# Altium schematic sheet Power_Sheet.SchDoc
size A4; SheetNumber: 1; SheetTotal: 1
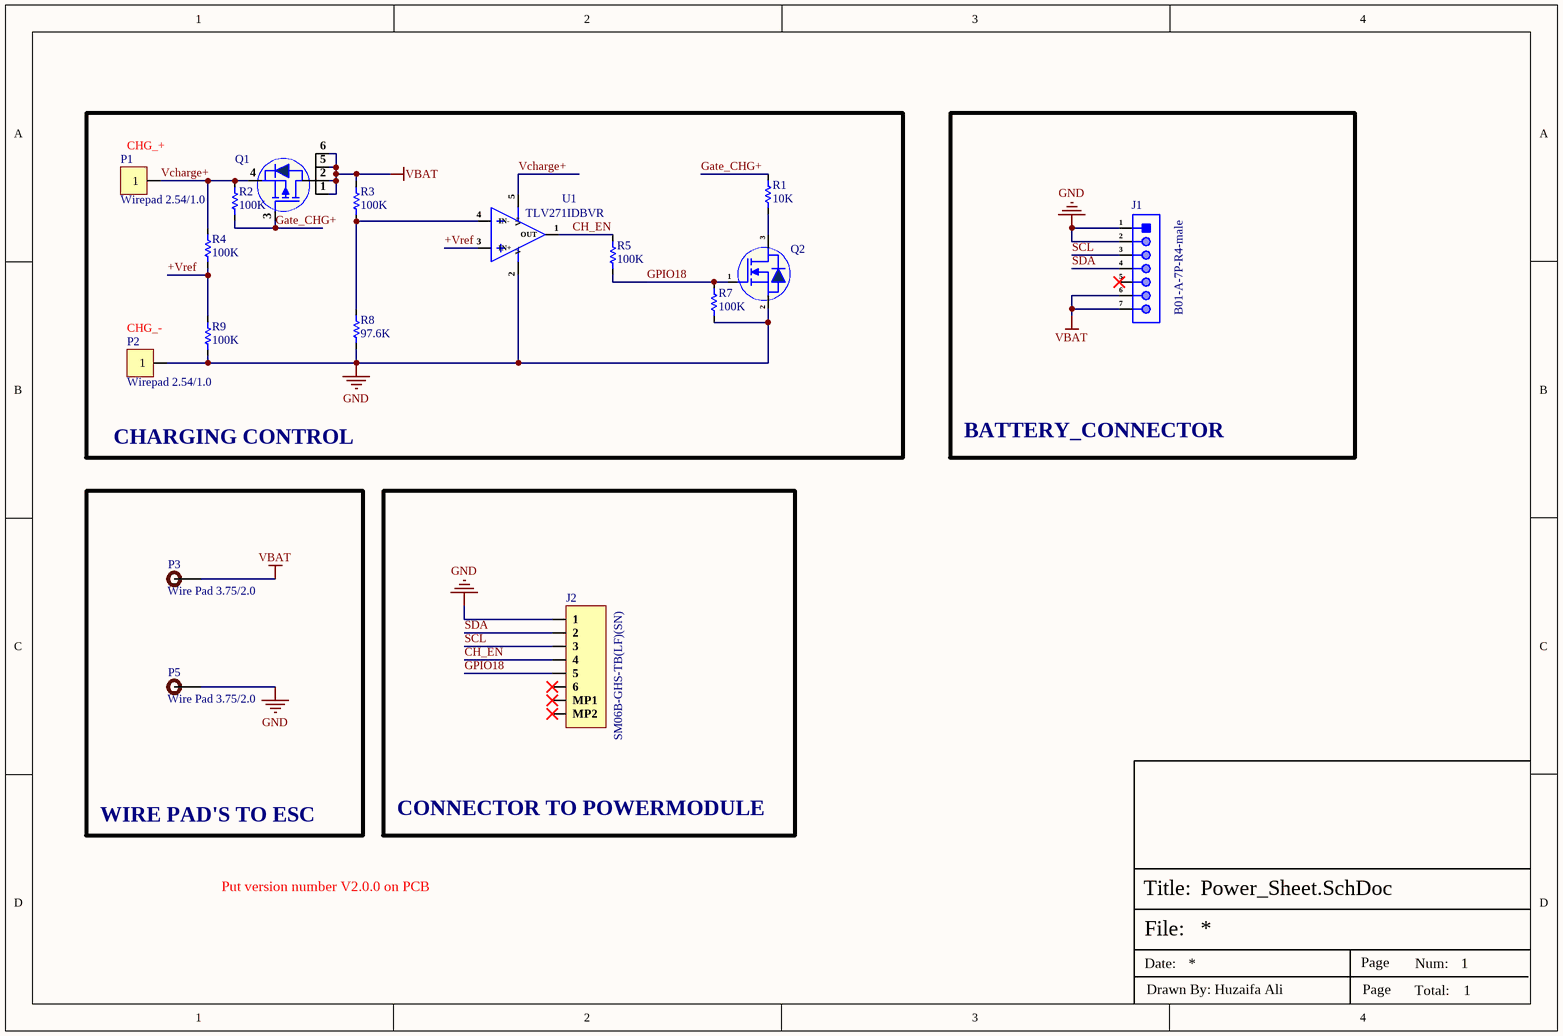
[diagram p0: Power_Sheet.SchDoc]

## Parts
J1  B01-A-7P-R4-male  [B01-A-7P-R4-male]
J2  SM06B-GHS-TB(LF)(SN)  [SM06B-GHS-TB(LF)(SN)]
P1  Wirepad 2.54/1.0  [Wirepad 2.54/1.0]  (no BOM)
P2  Wirepad 2.54/1.0  [Wirepad 2.54/1.0]  (no BOM)
P3  Wire Pad 3.75/2.0  [Wire Pad 3.75/2.0]  (no BOM)
P5  Wire Pad 3.75/2.0  [Wire Pad 3.75/2.0]  (no BOM)
Q1  IRLTS2242TRPBF  [6-TSOP_]  (value not drawn)
Q2  2N7002KT1G  [SOT-23]  (value not drawn)
R1  10K  [Res-0402]
R2  100K  [Res-0402]
R3  100K  [Res-0402]
R4  100K  [Res-0402]
R5  100K  [Res-0402]
R7  100K  [Res-0402]
R8  97.6K  [Res-0402]
R9  100K  [Res-0402]
U1  TLV271IDBVR  [SOT-23-5]

## Blocks framed on the sheet
CHARGING CONTROL: P1 P2 Q1 Q2 R1-R5 R7-R9 U1
BATTERY_CONNECTOR: J1
WIRE PAD'S TO ESC: P3 P5
CONNECTOR TO POWERMODULE: J2

## Nets
GND: J1.1 J1.2 J2.1 P2.1 P5.1 Q2.2(S) R7.2 R8.1 R9.2 U1.2(V-)
VBAT: J1.6 J1.7 P3.1 Q1.1(D) Q1.2(D) Q1.5(D) Q1.6(D) R3.1
+Vref: R4.2 R9.1 U1.3(IN+)
CH_EN: J2.4 R5.1 U1.1(OUT)
Gate_CHG+: Q1.3(G) R1.2 R2.2
GPIO18: J2.5 Q2.1(G) R5.2 R7.1
SCL: J1.3 J2.3
SDA: J1.4 J2.2
Vcharge+: P1.1 Q1.4(S) R2.1 R4.1 U1.5(V+)
NetQ2_3: Q2.3(D) R1.1
NetR3_2: R3.2 R8.2 U1.4(IN-)

Not connected (* = marked no-connect by the designer): J1 5*; J2 6* MP1* MP2*

## Notes on the sheet
- (near P1) CHG_+
- (near P2) CHG_-
- Put version number V2.0.0 on PCB
- File:
- Title:
- Date:
- Page
- Num:
- Total:
- Drawn By: Huzaifa Ali

## Library data of the parts
J1 = B01-A-7P-R4-male: 7 Pin Blade RA Male Connector; Manufacturer: RTLECS; Item Type: Blade Connector; Manufacturer Part Number: B01-A-7P-R4-male; Package: Custom; LCSC Part Number: -; ComponentLink1Description: LCSC; ComponentLink1URL: *
J2 = SM06B-GHS-TB(LF)(SN): CONN HEADER SMD R/A 6POS 1.25MM; Manufacturer: JST; Number of Positions: 6; Current Rating: 1A; Voltage Rating: 50V; Supplier: Future Electronics; LCSC Part Number: C133065; Manufacturer Part Number: SM06B-GHS-TB(LF)(SN); RoHS: Yes; Item Type: Headers; Pricing: 2500=0.25, 5000=0.245, 7500=0.24, 10000=0.235 (USD); Mounting Technology: Surface Mount; Contact Material: Bronze; Contact Shape: Rectangular; Contact Finish - Mating: TIN; Insulation Material: Nylon; Insulation Color: Natural; Min Operating Temperature: -25°C; Max Operating Temperature: 85°C; Number of Rows: 1; Packaging: Cut Tape; Termination: Solder; Fastening Type: Ramp; Connector Type: Header; Number of Contacts: 6; Orientation: Right Angle; Series: GH; Contact Type: Outer Shroud Contact; Pitch: 1.25mm; Lead Free: Lead Free; Flammability Rating: UL94 V-0; ComponentLink1URL: https://datasheet.ciiva.com/25617/0900766b810cef18-25617251.pdf?src-supplier=Rs; ComponentLink1Description: https://datasheet.ciiva.com/25617/0900766b810cef18-25617251.pdf?src-supplier=Rs; ComponentLink2URL: https://datasheet.ciiva.com/16487/jstsm06b-ghs-tb-lf-sn-16487196.pdf?src-supplier=Future+Electronics; ComponentLink2Description: https://datasheet.ciiva.com/16487/jstsm06b-ghs-tb-lf-sn-16487196.pdf?src-supplier=Future+Electronics
P3 P5 = Wire Pad 3.75/2.0: Wire Connecting Pad 3.75/2.0
Q1 = IRLTS2242TRPBF: MOSFET P-CH 20V 6.9A 6TSOP; Manufacturer: Infineon; Item Type: MOSFETs; Turn-Off Delay Time: 18ns; Turn-On Delay Time: 5.8ns; Drain to Source Breakdown Voltage: -20V; Drain to Source Resistance: 26mR; Element Configuration: 5460ElementConfiguration; Fall Time: 68ns; Number of Channels: 1NUMBER; On-State Resistance: -32mR; Power Dissipation: 2W; Value: 55MR; Supplier: Mouser; LCSC Part Number: C538190; Manufacturer Part Number: IRLTS2242TRPBF; RoHS: Yes; Stock: 67736; Pricing: 1=0.44, 10=0.372, 50=0.372, 100=0.259, 1000=0.164, 10000=0.129 (USD); Number of Elements: 1NUMBER; Package Quantity: 3000NUMBER; Length: 3mm; Width: 1.75mm; Height: 1.3mm; Radiation Hardening: 5898YesNo; ComponentLink1URL: http://www.farnell.com/datasheets/1911990.pdf?src-supplier=Farnell; ComponentLink1Description: http://www.farnell.com/datasheets/1911990.pdf?src-supplier=Farnell; ComponentLink2URL: http://www.farnell.com/datasheets/1911990.pdf?src-supplier=Element14; ComponentLink2Description: http://www.farnell.com/datasheets/1911990.pdf?src-supplier=Element14; ComponentLink3URL: https://datasheet.octopart.com/IRLTS2242TRPBF-Infineon-datasheet-41193307.pdf?src-supplier=Newark; ComponentLink3Description: https://datasheet.octopart.com/IRLTS2242TRPBF-Infineon-datasheet-41193307.pdf?src-supplier=Newark; ComponentLink4URL: https://www.infineon.com/dgdl/irlts2242pbf.pdf?fileId=5546d462533600a401535671e9a12718&src-supplier=Digikey; ComponentLink4Description: https://www.infineon.com/dgdl/irlts2242pbf.pdf?fileId=5546d462533600a401535671e9a12718&src-supplier=Digikey; ComponentLink5URL: https://datasheet.octopart.com/IRLTS2242TRPBF-Infineon-datasheet-11534477.pdf?src-supplier=Farnell; ComponentLink5Description: https://datasheet.octopart.com/IRLTS2242TRPBF-Infineon-datasheet-11534477.pdf?src-supplier=Farnell
Q2 = 2N7002KT1G: MOSFET N-CH 60V 320MA SOT23-3; Manufacturer: ON Semiconductor; Input Capacitance: 24.5pF; Max Power Dissipation: 420mW; Rds On Max: 1.6R; Rise Time: 9ns; Nominal Vgs: 2.3V; Number of Elements: 1; Power Dissipation: 300mW; Turn-Off Delay Time: 55.8ns; Turn-On Delay Time: 12.2ns; Element Configuration: Single; Gate to Source Voltage (Vgs): 20V; Polarity: N-CHANNEL; Number of Channels: 1NUMBER; Supplier: Future Electronics; Supplier Part Number: 3445699; Manufacturer Part Number: 2N7002KT1G; RoHS: Yes; Category: MOSFETs; Stock: 51000; Pricing: 3000=0.0238, 12000=0.0228, 45000=0.0218, 75000=0.0215, 150000=0.0204 (USD); Case/Package: SOT-23-3; Pins: 3; Contact Plating: Tin,Matte; Min Operating Temperature: -55°C; Max Operating Temperature: 150°C; Packaging: Tape and Reel; Continuous Drain Current (ID): 320mA; Package Quantity: 1; Drain to Source Breakdown Voltage: 60V; Fall Time: 9ns; Drain to Source Resistance: 1.6R; Threshold Voltage: 2.3V; Series: -; Drain-source On Resistance-Max: 1.6R; Length: 3.04mm; Width: 1.4mm; Height: 1.01mm; Radiation Hardening: No; Reach SVHC Compliant: No; Lead Free: Lead Free; Halogen Free: Halogen Free; RoHS Compliant: Yes; ComponentLink1URL: https://datasheet.ciiva.com/1254/2n7002k-d-1254499.pdf?src-supplier=Newark; ComponentLink1Description: https://datasheet.ciiva.com/1254/2n7002k-d-1254499.pdf?src-supplier=Newark; ComponentLink2URL: https://datasheet.ciiva.com/16220/2n7002k-d-16220919.pdf?src-supplier=Future+Electronics; ComponentLink2Description: https://datasheet.ciiva.com/16220/2n7002k-d-16220919.pdf?src-supplier=Future+Electronics; ComponentLink3URL: https://datasheet.ciiva.com/936/2n7002k-d-936793.pdf?src-supplier=Digikey; ComponentLink3Description: https://datasheet.ciiva.com/936/2n7002k-d-936793.pdf?src-supplier=Digikey; LCSC Part Number: C116584; Item Type: MOSFET
R1 = RC0402FR-0710KL: RES 10K OHM 1% 1/16W 0402; Manufacturer: Yageo; Resistance: 10kR; Voltage Rating (DC): 50V; Temperature Coefficient: 100ppm/°C; Power Rating: 62.5mW; Max Power Dissipation: 63mW; Item Type: Resistor; Supplier 1: Mouser; Manufacturer Part Number: RC0402FR-0710KL; RoHS: Yes; Category: Chip SMD Resistors; Stock 1: 18648329; Pricing 1: 1=0.10000, 10=0.01400, 50=0.01400, 100=0.00500, 1000=0.00300, 10000=0.00200 (USD); Case/Package: 0402; Number of Pins: 2; Case Code (Imperial): 0402; Case Code (Metric): 1005; Min Operating Temperature: -55°C; Max Operating Temperature: 155°C; Resistor Type: Thick Film; Tolerance: 1%; Packaging: Tape and Reel; Voltage Rating: 50V; Termination: SMD/SMT; Working Voltage: 50V; Number of Terminations: 2; Features: Moisture Resistant; Series: RC; Resistance Tolerance: 1%; Construction: Rectangular; Length: 1mm; Width: 0.5mm; Height: 0.32mm; Depth: 0.5mm; Lead Pitch: 0.2mm; REACH SVHC: No SVHC; Lead Free: Lead Free; RoHS Compliant: Yes; Military Standard: Not; ComponentLink1URL: https://datasheet.ciiva.com/7660/38568-7660787.pdf?src-supplier=Element14; ComponentLink1Description: https://datasheet.ciiva.com/7660/38568-7660787.pdf?src-supplier=Element14; ComponentLink2URL: https://datasheet.ciiva.com/7849/1686128-7849814.pdf?src-supplier=Element14; ComponentLink2Description: https://datasheet.ciiva.com/7849/1686128-7849814.pdf?src-supplier=Element14; ComponentLink3URL: https://datasheet.ciiva.com/7983/1018594-7983486.pdf?src-supplier=Element14; ComponentLink3Description: https://datasheet.ciiva.com/7983/1018594-7983486.pdf?src-supplier=Element14; ComponentLink4URL: https://datasheet.ciiva.com/22747/1018594-22747512.pdf?src-supplier=Element14; ComponentLink4Description: https://datasheet.ciiva.com/22747/1018594-22747512.pdf?src-supplier=Element14; ComponentLink5URL: https://datasheet.ciiva.com/12667/pyu-rc0402-51-rohs-l-6-r-12667067.pdf?src-supplier=Mouser; ComponentLink5Description: https://datasheet.ciiva.com/12667/pyu-rc0402-51-rohs-l-6-r-12667067.pdf?src-supplier=Mouser; ComponentLink6URL: https://datasheet.ciiva.com/7849/1784430-7849813.pdf?src-supplier=Element14; ComponentLink6Description: https://datasheet.ciiva.com/7849/1784430-7849813.pdf?src-supplier=Element14; ComponentLink7URL: https://datasheet.ciiva.com/7849/1784430-7849815.pdf?src-supplier=Element14; ComponentLink7Description: https://datasheet.ciiva.com/7849/1784430-7849815.pdf?src-supplier=Element14; Supplier Part Number 1: 603-RC0402FR-0710KL; LCSC Part Number: C60490
R2-R5 R7 R9 = RC0402FR-07100KL: RES 100K OHM 1% 1/16W 0402; Manufacturer: Yageo; Resistance: 100kR; Temperature Coefficient: 100ppm/°C; Power Rating: 63mW; Voltage Rating: 50V; Item Type: Resistor; Supplier 1: Mouser; Manufacturer Part Number: RC0402FR-07100KL; RoHS: Yes; Category: Chip SMD Resistors; Stock 1: 7759549; Pricing 1: 1=0.10000, 10=0.01200, 50=0.01200, 100=0.00500, 1000=0.00300, 2500=0.00200, 10000=0.00100 (USD); Case/Package: 0402; Case Code (Metric): 1005; Case Code (Imperial): 0402; Min Operating Temperature: -55°C; Max Operating Temperature: 155°C; Resistor Type: Thick Film; Tolerance: 1%; Packaging: Tape and Reel; Package Quantity: 1; Number of Terminations: 2; Termination: SMD/SMT; Max Power Dissipation: 63mW; Working Voltage: 50V; Features: Moisture Resistant; Series: RC; Resistance Tolerance: 1%; Construction: Rectangular; Technology: THICK FILM; Length: 0.039inch; Width: 0.02inch; Height: 0.016inch; Depth: 0.5mm; REACH SVHC: No SVHC; Lead Free: Lead Free; RoHS Compliant: Yes; Military Standard: Not; ComponentLink1URL: https://datasheet.ciiva.com/11819/0900766b80c66297-11819452.pdf?src-supplier=RSComponents; ComponentLink1Description: https://datasheet.ciiva.com/11819/0900766b80c66297-11819452.pdf?src-supplier=RSComponents; ComponentLink2URL: https://datasheet.ciiva.com/22747/1018594-22747509.pdf?src-supplier=Element14; ComponentLink2Description: https://datasheet.ciiva.com/22747/1018594-22747509.pdf?src-supplier=Element14; ComponentLink3URL: https://datasheet.ciiva.com/2453/pyu-r-int-thick-7-2453362.pdf?src-supplier=Digi-Key; ComponentLink3Description: https://datasheet.ciiva.com/2453/pyu-r-int-thick-7-2453362.pdf?src-supplier=Digi-Key; ComponentLink4URL: https://datasheet.ciiva.com/2453/pyu-r-int-thick-7-2453363.pdf?src-supplier=Digi-Key; ComponentLink4Description: https://datasheet.ciiva.com/2453/pyu-r-int-thick-7-2453363.pdf?src-supplier=Digi-Key; ComponentLink5URL: https://datasheet.ciiva.com/2453/pyu-r-int-thick-7-2453361.pdf?src-supplier=Digi-Key; ComponentLink5Description: https://datasheet.ciiva.com/2453/pyu-r-int-thick-7-2453361.pdf?src-supplier=Digi-Key; ComponentLink6URL: https://datasheet.ciiva.com/12667/pyu-rc0402-51-rohs-l-6-r-12667930.pdf?src-supplier=Mouser; ComponentLink6Description: https://datasheet.ciiva.com/12667/pyu-rc0402-51-rohs-l-6-r-12667930.pdf?src-supplier=Mouser; ComponentLink7URL: https://datasheet.ciiva.com/15189/getdatasheetpartid-323696-15189334.pdf?src-supplier=Verical; ComponentLink7Description: https://datasheet.ciiva.com/15189/getdatasheetpartid-323696-15189334.pdf?src-supplier=Verical; Supplier Part Number 1: 603-RC0402FR-07100KL; LCSC Part Number: C60491
R8 = RT0402BRD0797K6L: RES SMD 97.6KOHM 0.1% 1/16W 0402; Manufacturer: Yageo; Item Type: Resistors; Voltage Rating (DC): 50V; Supplier: Arrow Electronics; LCSC Part Number: C852964; Manufacturer Part Number: RT0402BRD0797K6L; RoHS: Yes; Stock: 301; Pricing: 1=0.0267, 10=0.0191, 25=0.0164, 100=0.0148, 250=0.0132 (USD); Lead Free: 5697LeadFree; ComponentLink1URL: https://datasheet.ciiva.com/2582/pyu-rt-1-to-0-05-rohs-l-5-2582537.pdf?src-supplier=Digikey; ComponentLink1Description: https://datasheet.ciiva.com/2582/pyu-rt-1-to-0-05-rohs-l-5-2582537.pdf?src-supplier=Digikey
U1 = TLV271IDBVR: IC CMOS 1 CIRCUIT SOT23-5; Manufacturer: Texas Instruments; Item Type: Opam; Supplier: Mouser; LCSC Part Number: C181500; Manufacturer Part Number: TLV271IDBVR; RoHS: Yes; Stock: 23196; Pricing: 1=0.9, 10=0.761, 50=0.761, 100=0.585, 1000=0.408, 10000=0.347 (USD); ComponentLink1URL: https://datasheet.ciiva.com/7848/1772259-7848320.pdf?src-supplier=Element14; ComponentLink1Description: https://datasheet.ciiva.com/7848/1772259-7848320.pdf?src-supplier=Element14; ComponentLink2URL: https://datasheet.ciiva.com/1796/tlv271-1796326.pdf?src-supplier=Digikey; ComponentLink2Description: https://datasheet.ciiva.com/1796/tlv271-1796326.pdf?src-supplier=Digikey; ComponentLink3URL: https://datasheet.ciiva.com/1796/tlv271-1796327.pdf?src-supplier=Digikey; ComponentLink3Description: https://datasheet.ciiva.com/1796/tlv271-1796327.pdf?src-supplier=Digikey; ComponentLink4URL: https://datasheet.ciiva.com/1796/tlv271-1796328.pdf?src-supplier=Digikey; ComponentLink4Description: https://datasheet.ciiva.com/1796/tlv271-1796328.pdf?src-supplier=Digikey; ComponentLink5URL: https://datasheet.ciiva.com/2974/slos351d-2974433.pdf?src-supplier=Avnet; ComponentLink5Description: https://datasheet.ciiva.com/2974/slos351d-2974433.pdf?src-supplier=Avnet; ComponentLink6URL: https://datasheet.ciiva.com/2974/slos351d-2974434.pdf?src-supplier=Avnet; ComponentLink6Description: https://datasheet.ciiva.com/2974/slos351d-2974434.pdf?src-supplier=Avnet; ComponentLink7URL: https://datasheet.ciiva.com/46383/1882561-46383869.pdf?src-supplier=Element14; ComponentLink7Description: https://datasheet.ciiva.com/46383/1882561-46383869.pdf?src-supplier=Element14